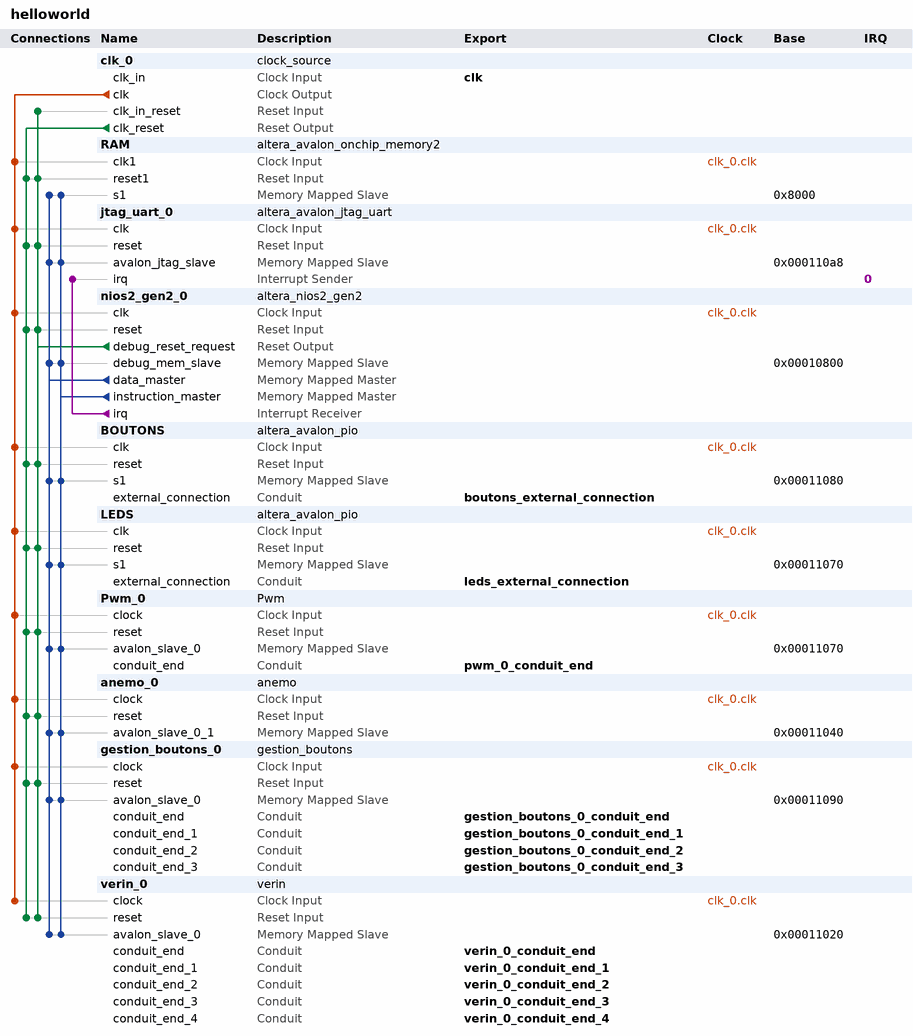
[diagram p0: system contents]
# Platform Designer (Qsys) system helloworld, Cyclone V 5CGXFC7C7F23C8
# Parameters at their usual value, and those the tool derives, are not listed.
package require -exact qsys 18.1
create_system helloworld
set_project_property DEVICE_FAMILY {Cyclone V}
set_project_property DEVICE 5CGXFC7C7F23C8

add_instance clk_0 clock_source 18.1
set_instance_parameter_value clk_0 clockFrequency 50000000

add_instance RAM altera_avalon_onchip_memory2 18.1
set_instance_parameter_value RAM dataWidth 32
set_instance_parameter_value RAM dualPort false
set_instance_parameter_value RAM initMemContent true
set_instance_parameter_value RAM initializationFileName onchip_mem.hex
set_instance_parameter_value RAM memorySize 20480

add_instance jtag_uart_0 altera_avalon_jtag_uart 18.1
set_instance_parameter_value jtag_uart_0 simInteractiveOptions NO_INTERACTIVE_WINDOWS

add_instance nios2_gen2_0 altera_nios2_gen2 18.1
set_instance_parameter_value nios2_gen2_0 dcache_size 2048
set_instance_parameter_value nios2_gen2_0 exceptionSlave RAM.s1
set_instance_parameter_value nios2_gen2_0 icache_size 4096
set_instance_parameter_value nios2_gen2_0 impl Tiny
set_instance_parameter_value nios2_gen2_0 resetSlave RAM.s1

add_instance BOUTONS altera_avalon_pio 18.1
set_instance_parameter_value BOUTONS direction Input
set_instance_parameter_value BOUTONS width 2

add_instance LEDS altera_avalon_pio 18.1
set_instance_parameter_value LEDS direction Output
set_instance_parameter_value LEDS width 8

add_instance Pwm_0 Pwm 1.0

add_instance anemo_0 anemo 1.0

add_instance gestion_boutons_0 gestion_boutons 1.0

add_instance verin_0 verin 1.0

# connections
add_connection clk_0.clk anemo_0.clock clock
add_connection clk_0.clk BOUTONS.clk clock
add_connection clk_0.clk gestion_boutons_0.clock clock
add_connection clk_0.clk jtag_uart_0.clk clock
add_connection clk_0.clk LEDS.clk clock
add_connection clk_0.clk nios2_gen2_0.clk clock
add_connection clk_0.clk Pwm_0.clock clock
add_connection clk_0.clk RAM.clk1 clock
add_connection clk_0.clk verin_0.clock clock
add_connection clk_0.clk_reset anemo_0.reset reset
add_connection clk_0.clk_reset BOUTONS.reset reset
add_connection clk_0.clk_reset gestion_boutons_0.reset reset
add_connection clk_0.clk_reset jtag_uart_0.reset reset
add_connection clk_0.clk_reset LEDS.reset reset
add_connection clk_0.clk_reset nios2_gen2_0.reset reset
add_connection clk_0.clk_reset Pwm_0.reset reset
add_connection clk_0.clk_reset RAM.reset1 reset
add_connection clk_0.clk_reset verin_0.reset reset
add_connection nios2_gen2_0.debug_reset_request anemo_0.reset reset
add_connection nios2_gen2_0.debug_reset_request BOUTONS.reset reset
add_connection nios2_gen2_0.debug_reset_request clk_0.clk_in_reset reset
add_connection nios2_gen2_0.debug_reset_request gestion_boutons_0.reset reset
add_connection nios2_gen2_0.debug_reset_request jtag_uart_0.reset reset
add_connection nios2_gen2_0.debug_reset_request LEDS.reset reset
add_connection nios2_gen2_0.debug_reset_request nios2_gen2_0.reset reset
add_connection nios2_gen2_0.debug_reset_request Pwm_0.reset reset
add_connection nios2_gen2_0.debug_reset_request RAM.reset1 reset
add_connection nios2_gen2_0.debug_reset_request verin_0.reset reset
add_connection nios2_gen2_0.data_master anemo_0.avalon_slave_0_1 avalon
set_connection_parameter_value nios2_gen2_0.data_master/anemo_0.avalon_slave_0_1 baseAddress 0x00011040
add_connection nios2_gen2_0.data_master BOUTONS.s1 avalon
set_connection_parameter_value nios2_gen2_0.data_master/BOUTONS.s1 baseAddress 0x00011080
add_connection nios2_gen2_0.data_master gestion_boutons_0.avalon_slave_0 avalon
set_connection_parameter_value nios2_gen2_0.data_master/gestion_boutons_0.avalon_slave_0 baseAddress 0x00011090
add_connection nios2_gen2_0.data_master jtag_uart_0.avalon_jtag_slave avalon
set_connection_parameter_value nios2_gen2_0.data_master/jtag_uart_0.avalon_jtag_slave baseAddress 0x000110a8
add_connection nios2_gen2_0.data_master LEDS.s1 avalon
set_connection_parameter_value nios2_gen2_0.data_master/LEDS.s1 baseAddress 0x00011070
add_connection nios2_gen2_0.data_master nios2_gen2_0.debug_mem_slave avalon
set_connection_parameter_value nios2_gen2_0.data_master/nios2_gen2_0.debug_mem_slave baseAddress 0x00010800
add_connection nios2_gen2_0.data_master Pwm_0.avalon_slave_0 avalon
set_connection_parameter_value nios2_gen2_0.data_master/Pwm_0.avalon_slave_0 baseAddress 0x00011070
add_connection nios2_gen2_0.data_master RAM.s1 avalon
set_connection_parameter_value nios2_gen2_0.data_master/RAM.s1 baseAddress 0x8000
add_connection nios2_gen2_0.data_master verin_0.avalon_slave_0 avalon
set_connection_parameter_value nios2_gen2_0.data_master/verin_0.avalon_slave_0 baseAddress 0x00011020
add_connection nios2_gen2_0.instruction_master anemo_0.avalon_slave_0_1 avalon
set_connection_parameter_value nios2_gen2_0.instruction_master/anemo_0.avalon_slave_0_1 baseAddress 0x00011040
add_connection nios2_gen2_0.instruction_master BOUTONS.s1 avalon
set_connection_parameter_value nios2_gen2_0.instruction_master/BOUTONS.s1 baseAddress 0x00011080
add_connection nios2_gen2_0.instruction_master gestion_boutons_0.avalon_slave_0 avalon
set_connection_parameter_value nios2_gen2_0.instruction_master/gestion_boutons_0.avalon_slave_0 baseAddress 0x00011090
add_connection nios2_gen2_0.instruction_master jtag_uart_0.avalon_jtag_slave avalon
set_connection_parameter_value nios2_gen2_0.instruction_master/jtag_uart_0.avalon_jtag_slave baseAddress 0x000110a8
add_connection nios2_gen2_0.instruction_master LEDS.s1 avalon
set_connection_parameter_value nios2_gen2_0.instruction_master/LEDS.s1 baseAddress 0x00011070
add_connection nios2_gen2_0.instruction_master nios2_gen2_0.debug_mem_slave avalon
set_connection_parameter_value nios2_gen2_0.instruction_master/nios2_gen2_0.debug_mem_slave baseAddress 0x00010800
add_connection nios2_gen2_0.instruction_master Pwm_0.avalon_slave_0 avalon
set_connection_parameter_value nios2_gen2_0.instruction_master/Pwm_0.avalon_slave_0 baseAddress 0x00011070
add_connection nios2_gen2_0.instruction_master RAM.s1 avalon
set_connection_parameter_value nios2_gen2_0.instruction_master/RAM.s1 baseAddress 0x8000
add_connection nios2_gen2_0.instruction_master verin_0.avalon_slave_0 avalon
set_connection_parameter_value nios2_gen2_0.instruction_master/verin_0.avalon_slave_0 baseAddress 0x00011020
add_connection nios2_gen2_0.irq jtag_uart_0.irq interrupt
set_connection_parameter_value nios2_gen2_0.irq/jtag_uart_0.irq irqNumber 0

# exported interfaces
add_interface boutons_external_connection conduit end
set_interface_property boutons_external_connection EXPORT_OF BOUTONS.external_connection
add_interface clk clock sink
set_interface_property clk EXPORT_OF clk_0.clk_in
add_interface gestion_boutons_0_conduit_end conduit end
set_interface_property gestion_boutons_0_conduit_end EXPORT_OF gestion_boutons_0.conduit_end
add_interface gestion_boutons_0_conduit_end_1 conduit end
set_interface_property gestion_boutons_0_conduit_end_1 EXPORT_OF gestion_boutons_0.conduit_end_1
add_interface gestion_boutons_0_conduit_end_2 conduit end
set_interface_property gestion_boutons_0_conduit_end_2 EXPORT_OF gestion_boutons_0.conduit_end_2
add_interface gestion_boutons_0_conduit_end_3 conduit end
set_interface_property gestion_boutons_0_conduit_end_3 EXPORT_OF gestion_boutons_0.conduit_end_3
add_interface leds_external_connection conduit end
set_interface_property leds_external_connection EXPORT_OF LEDS.external_connection
add_interface pwm_0_conduit_end conduit end
set_interface_property pwm_0_conduit_end EXPORT_OF Pwm_0.conduit_end
add_interface verin_0_conduit_end conduit end
set_interface_property verin_0_conduit_end EXPORT_OF verin_0.conduit_end
add_interface verin_0_conduit_end_1 conduit end
set_interface_property verin_0_conduit_end_1 EXPORT_OF verin_0.conduit_end_1
add_interface verin_0_conduit_end_2 conduit end
set_interface_property verin_0_conduit_end_2 EXPORT_OF verin_0.conduit_end_2
add_interface verin_0_conduit_end_3 conduit end
set_interface_property verin_0_conduit_end_3 EXPORT_OF verin_0.conduit_end_3
add_interface verin_0_conduit_end_4 conduit end
set_interface_property verin_0_conduit_end_4 EXPORT_OF verin_0.conduit_end_4

set_interconnect_requirement {$system} qsys_mm.clockCrossingAdapter HANDSHAKE
set_interconnect_requirement {$system} qsys_mm.enableEccProtection FALSE
set_interconnect_requirement {$system} qsys_mm.insertDefaultSlave FALSE
set_interconnect_requirement {$system} qsys_mm.maxAdditionalLatency 1

save_system helloworld.qsys
